# Altium schematic sheet Sheet1.SchDoc
size A4
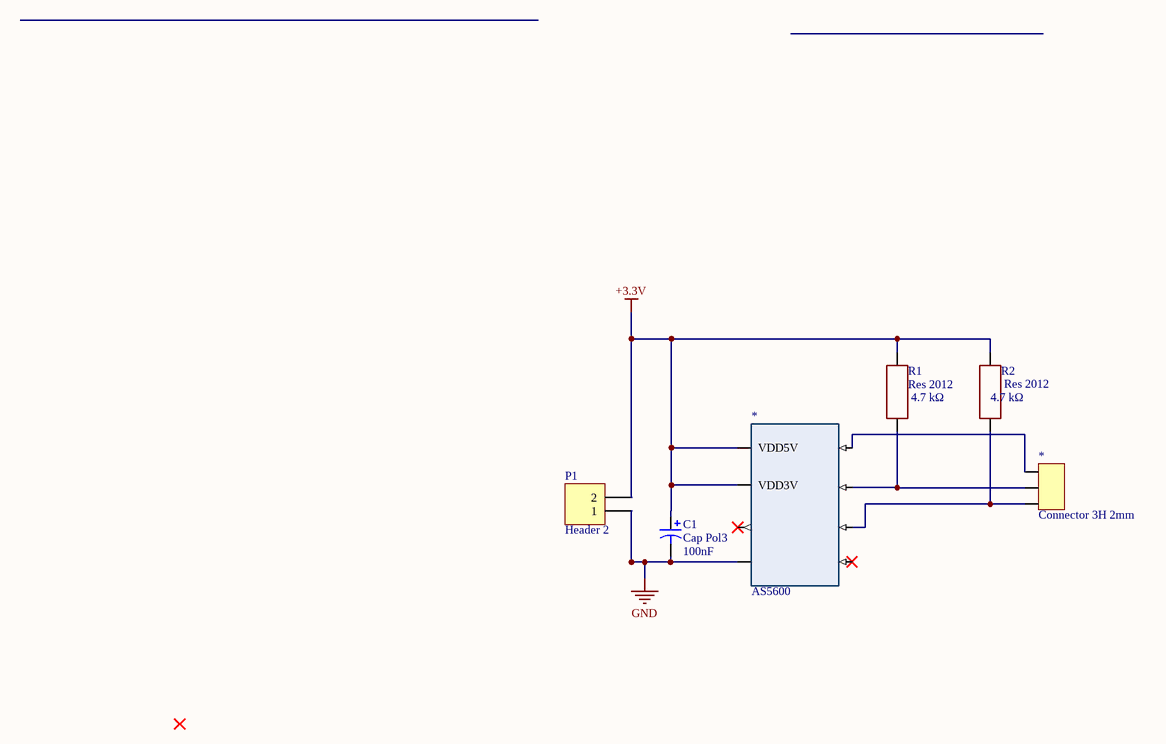
[diagram p0: Sheet1.SchDoc]

## Parts
(Parts that share a designator on the sheet are numbered #1, #2 ... from top to bottom, then left to right.)
*#1  AS5600  [AS5600]
*#2  Connector 3H 2mm  [Connector 3H 2mm]
C1  Cap Pol3  value 100nF  [C0805]
P1  Header 2  [HDR1X2]
R1  Res 2012  [Res2012]
R2  Res 2012  [Res2012]

## Nets
+3.3V: *#1.1(VDD5V) *#1.2(VDD3V) C1.1 P1.2 R1.2 R2.2
GND: *#1.4(GND) C1.2 P1.1
Net*#1_5: *#1.5(DIR) *#2.1
Net*#1_6: *#1.6(SCL) *#2.2 R1.1
Net*#1_7: *#1.7(SDA) *#2.3 R2.1

Not connected (* = marked no-connect by the designer): *#1 3(OUT)* 8(GPO)*

## Notes on the sheet
- (near R1) 4.7 kΩ
- (near R2) 4.7 kΩ

## Library data of the parts
C1 = Cap Pol3: Polarized Capacitor (Surface Mount); Published: 8-Jun-2000; LatestRevisionDate: 29-May-2009; LatestRevisionNote: IPC-7351 Footprint Added.; PackageReference: C0805; Publisher: Altium Limited; PackageDescription: Chip Capacitor
P1 = Header 2: Header, 2-Pin; LatestRevisionDate: 17-Jul-2002; LatestRevisionNote: Re-released for DXP Platform.; Publisher: Altium Limited